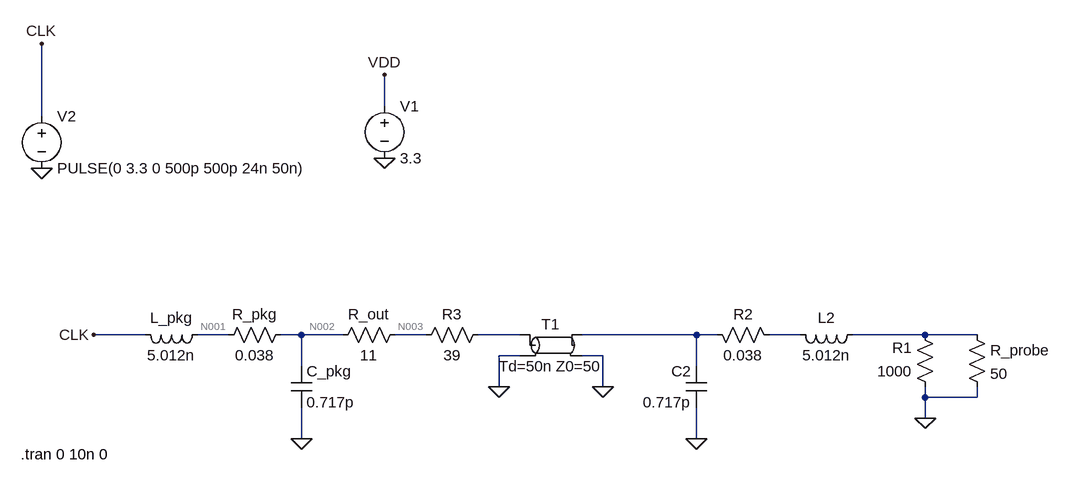
[diagram p0: schematic Draft9.asc]
Draft9.asc, the LTspice schematic file:
Version 4.1
SHEET 1 1032 680
WIRE 0 -80 0 -128
WIRE -528 -64 -528 -176
WIRE -368 272 -448 272
WIRE -240 272 -288 272
WIRE -128 272 -160 272
WIRE -64 272 -128 272
WIRE 64 272 16 272
WIRE 208 272 144 272
WIRE 480 272 304 272
WIRE 512 272 480 272
WIRE 640 272 592 272
WIRE 832 272 720 272
WIRE 912 272 832 272
WIRE 208 304 176 304
WIRE 336 304 304 304
WIRE -128 320 -128 272
WIRE 480 320 480 272
WIRE 176 352 176 304
WIRE 336 352 336 304
WIRE 832 368 832 352
WIRE 912 368 912 352
WIRE 912 368 832 368
WIRE 832 400 832 368
WIRE -128 432 -128 384
WIRE 480 432 480 384
FLAG -528 16 0
FLAG 0 0 0
FLAG 0 -128 VDD
FLAG -528 -176 CLK
FLAG -128 432 0
FLAG 480 432 0
FLAG 176 352 0
FLAG 336 352 0
FLAG -448 272 CLK
FLAG 832 400 0
SYMBOL voltage 0 -96 R0
WINDOW 123 0 0 Left 0
WINDOW 39 0 0 Left 0
SYMATTR InstName V1
SYMATTR Value 3.3
SYMBOL voltage -528 -80 R0
WINDOW 123 0 0 Left 0
WINDOW 39 0 0 Left 0
SYMATTR InstName V2
SYMATTR Value PULSE(0 3.3 0 500p 500p 24n 50n)
SYMBOL ind -272 256 R90
WINDOW 0 5 56 VBottom 2
WINDOW 3 32 56 VTop 2
SYMATTR InstName L_pkg
SYMATTR Value 5.012n
SYMATTR SpiceLine Rser=1m
SYMBOL res -144 256 R90
WINDOW 0 0 56 VBottom 2
WINDOW 3 32 56 VTop 2
SYMATTR InstName R_pkg
SYMATTR Value 0.038
SYMBOL cap -144 320 R0
SYMATTR InstName C_pkg
SYMATTR Value 0.717p
SYMBOL ind 624 256 M90
WINDOW 0 5 56 VBottom 2
WINDOW 3 32 56 VTop 2
SYMATTR InstName L2
SYMATTR Value 5.012n
SYMATTR SpiceLine Rser=1m
SYMBOL res 496 256 M90
WINDOW 0 0 56 VBottom 2
WINDOW 3 32 56 VTop 2
SYMATTR InstName R2
SYMATTR Value 0.038
SYMBOL cap 496 320 M0
SYMATTR InstName C2
SYMATTR Value 0.717p
SYMBOL res 160 256 R90
WINDOW 0 0 56 VBottom 2
WINDOW 3 32 56 VTop 2
SYMATTR InstName R3
SYMATTR Value 39
SYMBOL res 32 256 R90
WINDOW 0 0 56 VBottom 2
WINDOW 3 32 56 VTop 2
SYMATTR InstName R_out
SYMATTR Value 11
SYMBOL tline 256 288 R0
SYMATTR InstName T1
SYMBOL res 848 368 R180
WINDOW 0 36 76 Left 2
WINDOW 3 36 40 Left 2
SYMATTR InstName R1
SYMATTR Value 1000
SYMBOL res 896 256 R0
SYMATTR InstName R_probe
SYMATTR Value 50
TEXT -560 456 Left 2 !.tran 0 10n 0

The netlist it stands for:
* Draft9.asc
V1 VDD 0 3.3
V2 CLK 0 PULSE(0 3.3 0 500p 500p 24n 50n)
L_pkg N001 CLK 5.012n Rser=1m
R_pkg N002 N001 0.038
C_pkg N002 0 0.717p
L2 N006 N007 5.012n Rser=1m
R2 N005 N006 0.038
C2 N005 0 0.717p
R3 N004 N003 39
R_out N003 N002 11
T1 N004 0 N005 0 Td=50n Z0=50
R1 0 N007 1000
R_probe N007 0 50
.tran 0 10n 0
.backanno
.end

* Results of the author's LTspice run, read from the files saved beside the schematic
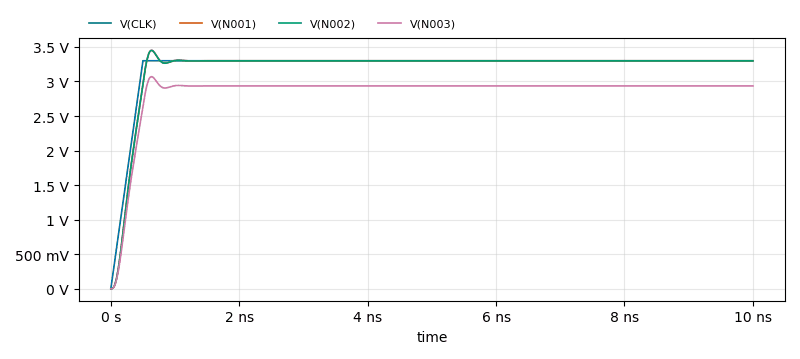
[diagram p1: Transient Analysis of Draft9.asc, plotted from the saved traces]
* Transient Analysis, 1 run:
*   V(CLK): min 0 V, max 3.3 V, average 3.217 V, rms 3.245 V, last 3.3 V
*   V(N001): min 0 V, max 3.45 V, average 3.201 V, rms 3.238 V, last 3.3 V
*   V(N002): min 0 V, max 3.449 V, average 3.2 V, rms 3.236 V, last 3.299 V
*   V(N003): min 0 V, max 3.07 V, average 2.848 V, rms 2.88 V, last 2.936 V